# EAGLE board Encoder PCB - REV 17.2 (EAGLE 7.5.0)
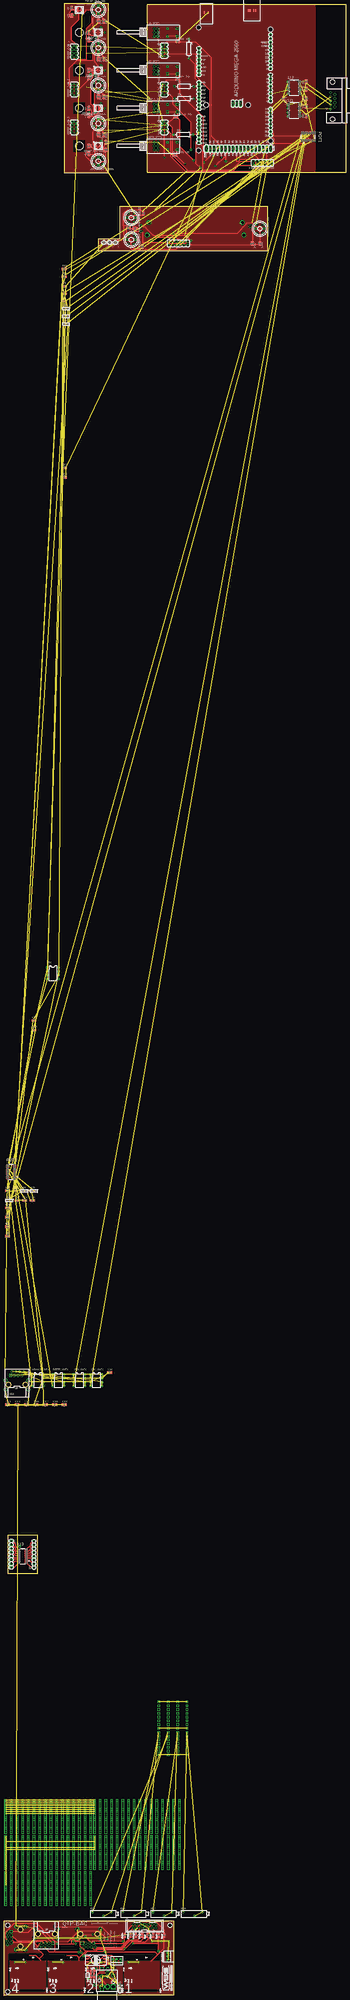
[diagram p11: board, top side]
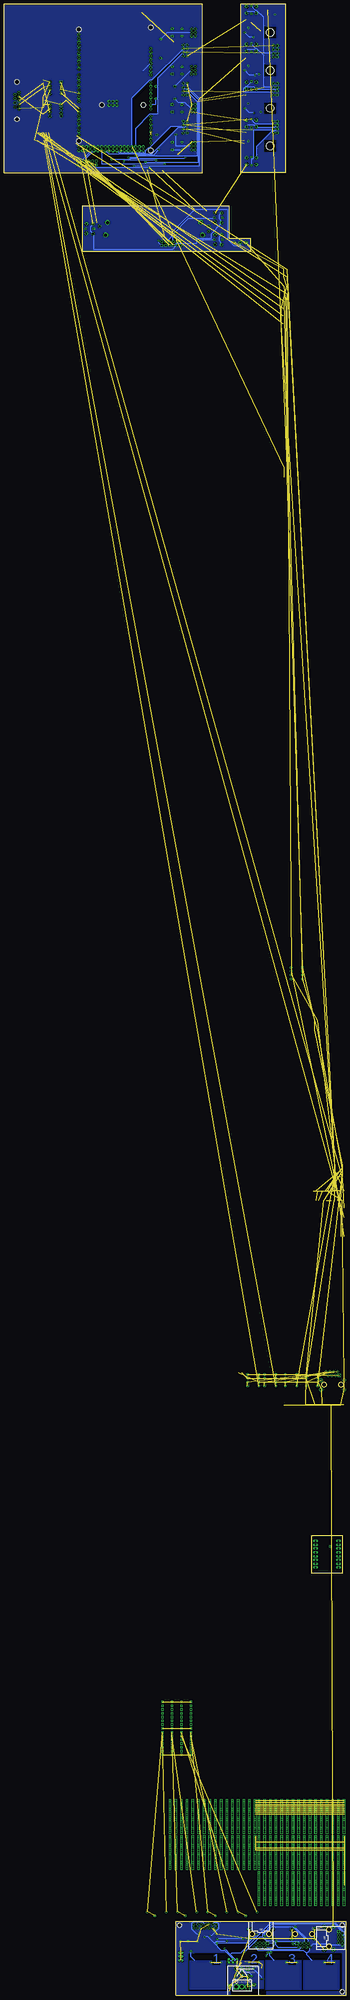
[diagram p12: board, bottom side, seen from below]

Size 229.87 x 1336.61 mm. Coordinates in mm from the lower left corner, seen from the top.
Outline: 0,0.32 0,49.85 114.3,49.85 114.3,0.32 0,0.32
Outline: 0,0.32 0,0
Outline: 40.64,1223.33 70.61,1223.33 70.61,1336.61 40.64,1336.61 40.64,1223.33
Outline: 63.88,1170.62 63.88,1179 78.11,1179 78.11,1200.59 177.17,1200.59 177.17,1170.62 63.88,1170.62
Outline: 96.52,1223.33 96.52,1336.36 229.87,1336.36 229.87,1223.33 96.52,1223.33
Outline: 2.54,283.53 22.84,283.53 22.84,308.93 2.54,308.93 2.54,283.53
Copper layers (1*16): Top 0.035mm / dielectric 1.5mm / Bottom 0.035mm
Design rules "LPKF Seneca Routing *": minimum track width 10mil, minimum drill 24mil, track to track 10mil, track to pad 10mil, pad to pad 10mil, via to via 10mil, smd to smd 8mil, copper to edge 10mil, drill to drill 10mil, minimum pad ring 14mil, minimum via ring 12mil, stop-mask expansion 4mil, vias tented up to drill 0mil, thermal gap 20mil
Net classes: 0 default: width 0.305 mm; 1 Pair 1: width 0.305 mm; 2 Pair 2: width 0.305 mm; 3 Pair 3: width 0.305 mm; 4 Pair 4: width 0.305 mm
Holes 5.08 mm at 50.8,1266.51 50.8,1241.11 50.8,1291.91 50.8,1317.31
Holes 2.8 mm at 111.76,47.31 2.54,47.31 2.54,2.86
tKeepout: area 47,1313.5 to 54.6,1321.1; area 1.8,35.1 to 3.8,36.1; 22 lines
bKeepout: area 1.5,35.1 to 3.6,36.4
tRestrict: area 47,1313.5 to 54.6,1321.1; area 47,1288.1 to 54.6,1295.7; area 47,1262.7 to 54.6,1270.3; area 47,1237.3 to 54.6,1244.9; area 1.5,34.9 to 3.8,36.4; 14 lines
bRestrict: area 47,1262.7 to 54.6,1270.3; area 47,1288.1 to 54.6,1295.7; area 47,1313.5 to 54.6,1321.1; area 47,1237.3 to 54.6,1244.9; area 1.5,34.9 to 3.8,36.4; 18 lines

## Footprints (pad centres in the part's own frame; a part is rotated, then mirrored left to right if it is on the bottom)
AMP_227161 = drill 0.9 pad 1.27: 1 0,-5.08; 2 -2.54,-5.08 | hole 2: -5.08,0; 5.08,0
C0805 = smd 1.3 x 1.5: 1 -0.95,0; 2 0.95,0
DIP8 = drill 0.8 square: P$1 -3.81,3.81 | drill 0.8: P$2 -3.81,1.27; P$3 -3.81,-1.27; P$4 -3.81,-3.81; P$5 3.81,3.81; P$6 3.81,1.27; P$7 3.81,-1.27; P$8 3.81,-3.81
WBS_10-081 = drill 1: P$1 0,2.5; P$2 0,0; P$3 0,-2.5; P$4 -2.5,2.5; P$5 -2.5,0; P$6 -2.5,-2.5 | drill 0.8 square: P$7 -9,2.5; P$8 -9,-2.5; P$9 -15.5,2.5; P$10 -15.5,-2.5
CON-PHOENIX_MC1.5/3-G-3.81 = drill 2.2 square: + 3.81,0 | drill 2.2: - 0,0; S -3.81,0
SWITCH-PODBUTTON = drill 0.8 pad 1.5: LEDA 0,2.7; LEDB 0,-2.7 | drill 1.2 pad 2: SW1A -3.25,2.25; SW1B -3.25,-2.25; SW2A 3.25,2.25; SW2B 3.25,-2.25
MA06-2 = drill 1.016 octagon: 1 -6.35,-1.27; 2 -6.35,1.27; 3 -3.81,-1.27; 4 -3.81,1.27; 5 -1.27,-1.27; 6 -1.27,1.27; 7 1.27,-1.27; 8 1.27,1.27; 9 3.81,-1.27; 10 3.81,1.27; 11 6.35,-1.27; 12 6.35,1.27
BOURNS-PTA6043_SLIDEPOT = drill 2 octagon: MOUNT1 -4.191,26.492; MOUNT2 4.166,25.349; MOUNT3 4.191,-37.389; MOUNT4 -4.191,-38.532 | drill 1.2: P$1 1.74,-42.724; P$3 -1.74,30.682 | drill 1.2 square: P$2 1.74,30.682
MA04-2 = drill 1.016 octagon: 1 -3.81,-1.27; 2 -3.81,1.27; 3 -1.27,-1.27; 4 -1.27,1.27; 5 1.27,-1.27; 6 1.27,1.27; 7 3.81,-1.27; 8 3.81,1.27
WS2812 = smd 2 x 1.1: DI 2,0; DO 2,-1.7; LEDVDD -2,0; NC -2,1.7; VDD 2,1.7; VSS -2,-1.7
LSP10 = drill 1.016 pad 2.159 octagon: MP 0,0
SJ = smd 1.168 x 1.6: 1 -0.762,0; 2 0.762,0
22-23-2031 = drill 1 long: 1 -2.54,0; 2 0,0; 3 2.54,0
1X08 = drill 1.016 long: 1 -8.89,0; 2 -6.35,0; 3 -3.81,0; 4 -1.27,0; 5 1.27,0; 6 3.81,0; 7 6.35,0; 8 8.89,0
PLACEHOLDER = drill 0.8 square: P$1 -12.7,8.89; P$2 -12.7,7.62; P$3 -12.7,6.35; P$4 -12.7,5.08; P$5 -12.7,3.81; P$6 -12.7,2.54; P$7 -12.7,1.27; P$8 -12.7,0; P$9 -12.7,-1.27; P$10 -12.7,-2.54; P$11 -12.7,-3.81; P$12 -12.7,-5.08; P$13 -12.7,-6.35; P$14 -12.7,-7.62; P$15 -12.7,-8.89; P$16 -12.7,-10.16; P$17 -12.7,-11.43; P$18 -12.7,-12.7; P$19 -8.89,8.89; P$20 -8.89,7.62; P$21 -8.89,6.35; P$22 -8.89,5.08; P$23 -8.89,3.81; P$24 -8.89,2.54; P$25 -8.89,1.27; P$26 -8.89,0; P$27 -8.89,-1.27; P$28 -8.89,-2.54; P$29 -8.89,-3.81; P$30 -8.89,-5.08; P$31 -8.89,-6.35; P$32 -8.89,-7.62; P$33 -8.89,-8.89; P$34 -8.89,-10.16; P$35 -8.89,-11.43; P$36 -8.89,-12.7; P$37 -5.08,8.89; P$38 -5.08,7.62; P$39 -5.08,6.35; P$40 -5.08,5.08; P$41 -5.08,3.81; P$42 -5.08,2.54; P$43 -5.08,1.27; P$44 -5.08,0; P$45 -5.08,-1.27; P$46 -5.08,-2.54; P$47 -5.08,-3.81; P$48 -5.08,-5.08; P$49 -5.08,-6.35; P$50 -5.08,-7.62; P$51 -5.08,-8.89; P$52 -5.08,-10.16; P$53 -5.08,-11.43; P$54 -5.08,-12.7; P$55 -1.27,8.89; P$56 -1.27,7.62; P$57 -1.27,6.35; P$58 -1.27,5.08; P$59 -1.27,3.81; P$60 -1.27,2.54; P$61 -1.27,1.27; P$62 -1.27,0; P$63 -1.27,-1.27; P$64 -1.27,-2.54; P$65 -1.27,-3.81; P$66 -1.27,-5.08; P$67 -1.27,-6.35; P$68 -1.27,-7.62; P$69 -1.27,-8.89; P$70 -1.27,-10.16; P$71 -1.27,-11.43; P$72 -1.27,-12.7; P$73 2.54,8.89; P$74 2.54,7.62; P$75 2.54,6.35; P$76 2.54,5.08; P$77 2.54,3.81; P$78 2.54,2.54; P$79 2.54,1.27; P$80 2.54,0; P$81 2.54,-1.27; P$82 2.54,-2.54; P$83 2.54,-3.81; P$84 2.54,-5.08; P$85 2.54,-6.35; P$86 2.54,-7.62; P$87 2.54,-8.89; P$88 2.54,-10.16; P$89 2.54,-11.43; P$90 2.54,-12.7; P$91 6.35,8.89; P$92 6.35,7.62; P$93 6.35,6.35; P$94 6.35,5.08; P$95 6.35,3.81; P$96 6.35,2.54; P$97 6.35,1.27; P$98 6.35,0; P$99 6.35,-1.27; P$100 6.35,-2.54; P$101 6.35,-3.81; P$102 6.35,-5.08; P$103 6.35,-6.35; P$104 6.35,-7.62; P$105 6.35,-8.89; P$106 6.35,-10.16; P$107 6.35,-11.43; P$108 6.35,-12.7; P$109 10.16,8.89; P$110 10.16,7.62; P$111 10.16,6.35; P$112 10.16,5.08; P$113 10.16,3.81; P$114 10.16,2.54; P$115 10.16,1.27; P$116 10.16,0; P$117 10.16,-1.27; P$118 10.16,-2.54; P$119 10.16,-3.81; P$120 10.16,-5.08; P$121 10.16,-6.35; P$122 10.16,-7.62; P$123 10.16,-8.89; P$124 10.16,-10.16; P$125 10.16,-11.43; P$126 10.16,-12.7; P$127 13.97,8.89; P$128 13.97,7.62; P$129 13.97,6.35; P$130 13.97,5.08; P$131 13.97,3.81; P$132 13.97,2.54; P$133 13.97,1.27; P$134 13.97,0; P$135 13.97,-1.27; P$136 13.97,-2.54; P$137 13.97,-3.81; P$138 13.97,-5.08; P$139 13.97,-6.35; P$140 13.97,-7.62; P$141 13.97,-8.89; P$142 13.97,-10.16; P$143 13.97,-11.43; P$144 13.97,-12.7; P$145 17.78,8.89; P$146 17.78,7.62; P$147 17.78,6.35; P$148 17.78,5.08; P$149 17.78,3.81; P$150 17.78,2.54; P$151 17.78,1.27; P$152 17.78,0; P$153 17.78,-1.27; P$154 17.78,-2.54; P$155 17.78,-3.81; P$156 17.78,-5.08; P$157 17.78,-6.35; P$158 17.78,-7.62; P$159 17.78,-8.89; P$160 17.78,-10.16; P$161 17.78,-11.43; P$162 17.78,-12.7; P$163 21.59,8.89; P$164 21.59,7.62; P$165 21.59,6.35; P$166 21.59,5.08; P$167 21.59,3.81; P$168 21.59,2.54; P$169 21.59,1.27; P$170 21.59,0; P$171 21.59,-1.27; P$172 21.59,-2.54; P$173 21.59,-3.81; P$174 21.59,-5.08; P$175 21.59,-6.35; P$176 21.59,-7.62; P$177 21.59,-8.89; P$178 21.59,-10.16; P$179 21.59,-11.43; P$180 21.59,-12.7; P$181 25.4,8.89; P$182 25.4,7.62; P$183 25.4,6.35; P$184 25.4,5.08; P$185 25.4,3.81; P$186 25.4,2.54; P$187 25.4,1.27; P$188 25.4,0; P$189 25.4,-1.27; P$190 25.4,-2.54; P$191 25.4,-3.81; P$192 25.4,-5.08; P$193 25.4,-6.35; P$194 25.4,-7.62; P$195 25.4,-8.89; P$196 25.4,-10.16; P$197 25.4,-11.43; P$198 25.4,-12.7; P$199 29.21,8.89; P$200 29.21,7.62; P$201 29.21,6.35; P$202 29.21,5.08; P$203 29.21,3.81; P$204 29.21,2.54; P$205 29.21,1.27; P$206 29.21,0; P$207 29.21,-1.27; P$208 29.21,-2.54; P$209 29.21,-3.81; P$210 29.21,-5.08; P$211 29.21,-6.35; P$212 29.21,-7.62; P$213 29.21,-8.89; P$214 29.21,-10.16; P$215 29.21,-11.43; P$216 29.21,-12.7; P$217 33.02,8.89; P$218 33.02,7.62; P$219 33.02,6.35; P$220 33.02,5.08; P$221 33.02,3.81; P$222 33.02,2.54; P$223 33.02,1.27; P$224 33.02,0; P$225 33.02,-1.27; P$226 33.02,-2.54; P$227 33.02,-3.81; P$228 33.02,-5.08; P$229 33.02,-6.35; P$230 33.02,-7.62; P$231 33.02,-8.89; P$232 33.02,-10.16; P$233 33.02,-11.43; P$234 33.02,-12.7; P$235 36.83,8.89; P$236 36.83,7.62; P$237 36.83,6.35; P$238 36.83,5.08; P$239 36.83,3.81; P$240 36.83,2.54; P$241 36.83,1.27; P$242 36.83,0; P$243 36.83,-1.27; P$244 36.83,-2.54; P$245 36.83,-3.81; P$246 36.83,-5.08; P$247 36.83,-6.35; P$248 36.83,-7.62; P$249 36.83,-8.89; P$250 36.83,-10.16; P$251 36.83,-11.43; P$252 36.83,-12.7; P$253 40.64,8.89; P$254 40.64,7.62; P$255 40.64,6.35; P$256 40.64,5.08; P$257 40.64,3.81; P$258 40.64,2.54; P$259 40.64,1.27; P$260 40.64,0; P$261 40.64,-1.27; P$262 40.64,-2.54; P$263 40.64,-3.81; P$264 40.64,-5.08; P$265 40.64,-6.35; P$266 40.64,-7.62; P$267 40.64,-8.89; P$268 40.64,-10.16; P$269 40.64,-11.43; P$270 40.64,-12.7; P$271 44.45,8.89; P$272 44.45,7.62; P$273 44.45,6.35; P$274 44.45,5.08; P$275 44.45,3.81; P$276 44.45,2.54; P$277 44.45,1.27; P$278 44.45,0; P$279 44.45,-1.27; P$280 44.45,-2.54; P$281 44.45,-3.81; P$282 44.45,-5.08; P$283 44.45,-6.35; P$284 44.45,-7.62; P$285 44.45,-8.89; P$286 44.45,-10.16; P$287 44.45,-11.43; P$288 44.45,-12.7
M0805 = smd 1.3 x 1.6: 1 -0.95,0; 2 0.95,0
MCS10B = drill 1.016 pad 2.159 octagon: MP 0,0
ARDUINO_MEGA2560 = drill 1.016 pad 1.88: 0 63.5,50.8; 1 60.96,50.8; 2 58.42,50.8; 3 55.88,50.8; 3.3V 35.56,2.54; 4 53.34,50.8; 5 50.8,50.8; 5V 38.1,2.54; 5V. 93.98,50.8; 5V.. 96.52,50.8; 6 48.26,50.8; 7 45.72,50.8; 8 41.656,50.8; 9 39.116,50.8; 10 36.576,50.8; 11 34.036,50.8; 12 31.496,50.8; 13 28.956,50.8; 14 68.58,50.8; 15 71.12,50.8; 16 73.66,50.8; 17 76.2,50.8; 18 78.74,50.8; 19 81.28,50.8; 20 83.82,50.8; 21 86.36,50.8; A0 50.8,2.54; A1 53.34,2.54; A2 55.88,2.54; A3 58.42,2.54; A4 60.96,2.54; A5 63.5,2.54; A6 66.04,2.54; A7 68.58,2.54; A8 73.66,2.54; A9 76.2,2.54; A10 78.74,2.54; A11 81.28,2.54; A12 83.82,2.54; A13 86.36,2.54; A14 88.9,2.54; A15 91.44,2.54; AREF 23.876,50.8; GND 26.416,50.8; GND. 43.18,2.54; GND.. 40.64,2.54; GND... 93.98,7.62; GND.... 96.52,7.62; I/OREF 30.48,2.54; N/C 27.94,2.54; RESET 33.02,2.54; SCL1 18.796,50.8; SDA1 21.336,50.8; VIN 45.72,2.54 | drill 1.016 pad 1.88 octagon: 22 93.98,48.26; 23 96.52,48.26; 24 93.98,45.72; 25 96.52,45.72; 26 93.98,43.18; 27 96.52,43.18; 28 93.98,40.64; 29 96.52,40.64; 30 93.98,38.1; 31 96.52,38.1; 32 93.98,35.56; 33 96.52,35.56; 34 93.98,33.02; 35 96.52,33.02; 36 93.98,30.48; 37 96.52,30.48; 38 93.98,27.94; 39 96.52,27.94; 40 93.98,25.4; 41 96.52,25.4; 42 93.98,22.86; 43 96.52,22.86; 44 93.98,20.32; 45 96.52,20.32; 46 93.98,17.78; 47 96.52,17.78; 48 93.98,15.24; 49 96.52,15.24; 50 93.98,12.7; 51 96.52,12.7; 52 93.98,10.16; 53 96.52,10.16; +5V_ 66.04,30.48; GND__ 66.04,25.4; MISO 63.5,30.48; MOSI 66.04,27.94; RESET. 63.5,25.4; SCK 63.5,27.94 | smd 1.016 x 0.508: <PWR>+V 3.81,8.89; <PWR>-V 3.81,6.35; <USB>+V 2.54,40.64; <USB>D+ 2.54,39.37; <USB>D- 2.54,36.83; <USB>GND 2.54,35.56 | hole 3.2: 15.24,50.8; 13.97,2.54; 66.04,35.56; 66.04,7.62; 90.17,50.8; 96.52,2.54
SOIC127P600X175-16N = smd 1.981 x 0.533: 1 -2.464,4.445; 2 -2.464,3.175; 3 -2.464,1.905; 4 -2.464,0.635; 5 -2.464,-0.635; 6 -2.464,-1.905; 7 -2.464,-3.175; 8 -2.464,-4.445; 9 2.464,-4.445; 10 2.464,-3.175; 11 2.464,-1.905; 12 2.464,-0.635; 13 2.464,0.635; 14 2.464,1.905; 15 2.464,3.175; 16 2.464,4.445
ASSMAN-RJ45 = drill 1.1: P1+ -3.162,17.196; P2+ -0.622,17.196; P2- 0.648,14.656; P3+ 1.918,17.196; P3- -1.892,14.656; P4+ 4.458,17.196; P4- 3.188,14.656 | drill 1.1 square: P1- -4.432,14.656 | drill 1.5: P$9 -7.744,5.131; P$10 7.767,5.131; P$11 -7.744,11.349; P$12 7.767,11.349 | hole 3.2: -5.702,8.306; 5.728,8.306 | hole 3.175: -5.702,8.306
0309/12 = drill 0.813 octagon: 1 -6.35,0; 2 6.35,0
RTRIM43P = drill 0.9: 1 -7.62,1.27; 2 0,-1.27; 3 5.08,1.27
R0805W = smd 1.5 x 1: 1 -1.052,0; 2 1.052,0
SJ_2 = smd 1.168 x 1.6: 1 -1.524,0; 2 0,0; 3 1.524,0
M450A_AMPLIFIER = drill 0.8 square: P$1 -3.81,10.16; P$2 -3.81,7.62; P$3 -3.81,5.08; P$4 -3.81,2.54; P$5 -3.81,0; P$6 -3.81,-2.54; P$7 -3.81,-5.08; P$8 -3.81,-7.62; P$9 -3.81,-10.16; P$10 -3.81,-12.7; P$11 -3.81,-15.24; P$12 -3.81,-17.78; P$13 -3.81,-20.32; P$14 -3.81,-22.86; P$15 -3.81,-25.4
SCHOTT_61454 = smd 0.965 x 1.778: P1 -3.01,-5.779; P2 -1.003,-5.779; P3 1.003,-5.779; P4 3.01,-5.779; P5 3.01,5.779; P6 1.003,5.779; P7 -1.003,5.779; P8 -3.01,5.779
DIP254P762X508-8 = drill 1.118 square: 1 -7.62,7.62 | drill 1.118: 2 -7.62,5.08; 3 -7.62,2.54; 4 -7.62,0; 5 0,0; 6 0,2.54; 7 0,5.08; 8 0,7.62
VU_METER = drill 0.8 square: P$1 -5.08,0; P$2 5.08,0
H3M09RA = drill 1.092: 1 -5.537,1.422; 2 -2.769,1.422; 3 0,1.422; 4 2.769,1.422; 5 5.537,1.422; 6 -4.153,-1.422; 7 -1.384,-1.422; 8 1.384,-1.422; 9 4.153,-1.422 | hole 3.048: -12.497,0; 12.497,0
PAK100/2500-14 = drill 1 pad 1.422: 1 -7.62,-1.27; 2 -7.62,1.27; 3 -5.08,-1.27; 4 -5.08,1.27; 5 -2.54,-1.27; 6 -2.54,1.27; 7 0,-1.27; 8 0,1.27; 9 2.54,-1.27; 10 2.54,1.27; 11 5.08,-1.27; 12 5.08,1.27; 13 7.62,-1.27; 14 7.62,1.27
CON_NEUTRIK_A_BISEXUAL_H = drill 1.2 pad 2.184: CHASSIS -8.25,7; GROUND 0,12.7 | drill 1.6: F1 -3.81,12.7; F2 3.81,13.335; M1 3.81,17.78; SHARED3 0,17.462 | drill 1.6 pad 2.032 square: FAKEHOLE -3.81,3.81 | drill 1.6 square: M2 -3.81,17.78 | hole 1.2: 0,12.7 | hole 1.6: 3.81,8.89

## Placement (x,y rotation side)
APK1  Quad Summing  [WBS-FRAME_PCB]  1.27,199.71 0 top
APK3  VU METER PANEL  [WBS-FRAME_PCB]  1.27,1352.87 0 top  (outside the outline)
BNC2  1-227161-0  [AMP_227161]  69.34,10.22 180 top
C1  104  [C0805]  57.15,1312.23 270 top
C2  104  [C0805]  57.15,1286.83 270 top
C3  104  [C0805]  57.15,1261.43 90 top
C4  104  [C0805]  57.15,1236.03 90 top
C5  104  [C0805]  45.72,1328.74 90 top
C6  [C0805]  40.64,1147.13 0 top
C7  [C0805]  40.64,1142.05 0 top
C8  [C0805]  40.64,1136.97 0 top
C9  100n  [C0805]  20.32,654.37 0 top
C10  100n  [C0805]  20.32,648.02 0 top
C11  [C0805]  19.05,533.72 0 top
C12  [C0805]  8.89,533.72 0 top
C14  100n/50v  [C0805]  70.17,23.18 90 top
C21  [C0805]  13.97,533.72 0 top
C22  100n  [C0805]  71.12,418.15 0 top
C23  100n  [C0805]  2.54,396.56 0 top
C24  100n  [C0805]  8.89,396.56 0 top
C25  100n  [C0805]  15.24,396.56 0 top
C26  100n  [C0805]  21.59,396.56 0 top
C27  100n  [C0805]  27.94,396.56 0 top
C28  100n  [C0805]  34.29,396.56 0 top
C29  100n  [C0805]  40.64,396.56 0 top
EARTH_OUT1  OPAMP-THAT1646_LINE_DRIVER  [DIP8]  36.83,413.07 0 top
EARTH_POT1  WBS_10-081_DUALPOT+DUALSWITCH  [WBS_10-081]  101.09,1241.11 180 top
EURO-BLOCK_2  CON-PHOENIX_RIGHT_ANGLE_3.81  [CON-PHOENIX_MC1.5/3-G-3.81]  69.85,6.03 180 bottom
FADER_BUT_ON  SWITCH-POD-BUTTON_WITH_LED  [SWITCH-PODBUTTON]  172.08,1185.61 90 top
FADER_BUT_ONLY  SWITCH-POD-BUTTON_WITH_LED  [SWITCH-PODBUTTON]  85.72,1178.24 90 top
FADER_BUT_SEL  SWITCH-POD-BUTTON_WITH_LED  [SWITCH-PODBUTTON]  85.72,1192.97 90 top
FADER_CONNECTOR  [MA06-2]  173.99,1229.68 180 top
FADER_LIN_SLIDE  BOURNS-PTA6043_SLIDEPOT  [BOURNS-PTA6043_SLIDEPOT]  122.81,1185.61 90 top
FRONT_BUT_EARTH  SWITCH-POD-BUTTON_WITH_LED  [SWITCH-PODBUTTON]  63.5,1230.95 0 top
FRONT_BUT_GRASS  SWITCH-POD-BUTTON_WITH_LED  [SWITCH-PODBUTTON]  63.5,1256.35 180 top
FRONT_BUT_SEL  SWITCH-POD-BUTTON_WITH_LED  [SWITCH-PODBUTTON]  63.5,1332.55 180 top
FRONT_BUT_SKY  SWITCH-POD-BUTTON_WITH_LED  [SWITCH-PODBUTTON]  63.5,1281.75 180 top
FRONT_BUT_SUN  SWITCH-POD-BUTTON_WITH_LED  [SWITCH-PODBUTTON]  63.5,1307.15 180 top
FRONT_CON_1  [MA04-2]  47.35,1304.61 90 top
FRONT_CON_2  [MA04-2]  47.35,1279.21 90 top
FRONT_CON_3  [MA04-2]  47.35,1253.81 90 top
FRONT_EARTH  WS2812  [WS2812]  63.5,1241.11 180 top
FRONT_GRASS  WS2812  [WS2812]  63.5,1266.51 180 top
FRONT_SKY  WS2812  [WS2812]  63.5,1291.91 180 top
FRONT_SUN  WS2812  [WS2812]  63.5,1317.31 180 top
FRONT_SUN1  WS2812  [WS2812]  50.8,1332.55 0 top
G2  LSP10  [LSP10]  78.11,6.67 0 top
GND-2  [SJ]  78.11,3.81 270 top
GRASS_OUT1  OPAMP-THAT1646_LINE_DRIVER  [DIP8]  22.86,413.07 0 top
GRASS_POT1  WBS_10-081_DUALPOT+DUALSWITCH  [WBS_10-081]  101.09,1266.51 180 top
GROUND_POST  22-23-2031  [22-23-2031]  110.81,26.35 270 top
JP1  [1X08]  5.08,296.23 270 top
JP2  [1X08]  20.32,296.23 90 top
LINE_IN  QTP-OUT  [PLACEHOLDER]  13.97,1476.06 0 top  (outside the outline)
LINK_1  0  [M0805]  187.96,1272.86 270 top
LSP1  MCS10B  [MCS10B]  67.31,1176.34 270 top
LSP2  MCS10B  [MCS10B]  71.12,1176.34 270 top
LSP3  MCS10B  [MCS10B]  74.93,1176.34 270 top
MAIN_TO_FRONT_CON_1  [MA04-2]  107.95,1305.24 90 top
MAIN_TO_FRONT_CON_2  [MA04-2]  107.95,1279.21 90 top
MAIN_TO_FRONT_CON_3  [MA04-2]  107.95,1253.81 90 top
NEOPIXEL1  QTP-IN  [PLACEHOLDER]  13.97,1407.48 0 top  (outside the outline)
OUT_A  QTP-IN  [PLACEHOLDER]  13.97,122.24 0 top
OUT_B  QTP-IN  [PLACEHOLDER]  73.66,122.24 0 top
PAN_CON_2  22-23-2031  [22-23-2031]  75.88,23.49 180 top
PCB1  ARDUINO_MEGA2560  [ARDUINO_MEGA2560]  128.52,1334.58 270 top
POT1  DS1808Z-050+  [SOIC127P600X175-16N]  204.47,1247.46 270 top
POT2  DS1808Z-050+  [SOIC127P600X175-16N]  5.08,552.77 0 top
QTP1  [ASSMAN-RJ45]  19.69,38.73 270 bottom
QTP2  [ASSMAN-RJ45]  57.15,49.85 180 bottom
QTP_CENTER  [ASSMAN-RJ45]  28.58,49.85 180 top
R1  150R  [M0805]  57.15,1317.31 90 top
R2  150R  [M0805]  57.15,1291.91 270 top
R3  150R  [M0805]  57.15,1266.51 90 top
R4  150R  [M0805]  57.15,1241.11 270 top
R5  150R  [M0805]  45.72,1333.82 90 top
R6  [0309/12]  124.46,1306.51 270 top
R7  [0309/12]  121.28,1281.11 0 top
R8  [0309/12]  121.28,1272.86 0 top
R9  10K  [M0805]  203.2,1284.29 90 top
R10  [0309/12]  120.65,1248.73 0 top
R11  10K  [M0805]  203.2,1261.43 90 top
R12  10K  [M0805]  203.2,1272.86 90 top
R13  10K  [M0805]  203.2,1267.78 90 top
R14  10K  [M0805]  203.2,1279.21 90 top
R15  4.7K  [M0805]  40.64,1158.56 0 top
R16  4.7K  [M0805]  40.64,1153.48 0 top
R17  4.7K  [M0805]  2.54,540.07 0 top
R18  4.7K  [M0805]  7.62,540.07 0 top
R19  10k  [M0805]  2.54,528.64 0 top
R20  10k  [M0805]  2.54,522.29 0 top
R21  10k  [M0805]  2.54,515.94 0 top
R22  10k  [M0805]  2.54,509.59 0 top
R23  330R  [M0805]  40.64,1025.21 0 top
R24  100k  [M0805]  40.64,1018.86 0 top
R25  [RTRIM43P]  67.31,54.93 0 top
R26  [RTRIM43P]  87.63,54.93 0 top
R27  [RTRIM43P]  107.95,54.93 0 top
R28  [RTRIM43P]  128.27,54.93 0 top
R201  0R  [R0805W]  60.64,13.65 90 top
R202  37R5  [R0805W]  58.42,13.65 90 top
R203  75R  [R0805W]  56.52,17.46 90 top
R204  37R5  [R0805W]  59.69,16.83 0 top
R_EARTH_SW  10K  [M0805]  114.94,1234.76 0 top
R_GRASS_SW  10K  [M0805]  115.57,1260.16 0 top
R_SKY_SW  10K  [M0805]  116.84,1285.56 0 top
R_SUN_SW  10K  [M0805]  116.84,1310.96 0 top
REARTH+  0R  [R0805W]  85.09,40.64 90 top
REARTH-  0R  [R0805W]  81.28,40.64 90 top
RGRASS+  0R  [R0805W]  92.71,40.64 90 top
RGRASS-  0R  [R0805W]  88.9,40.64 90 top
RS1  10K  [M0805]  63.5,1324.93 270 top
RS2  10K  [M0805]  67.31,1324.93 270 top
RS3  10K  [M0805]  63.5,1299.53 270 top
RS4  10K  [M0805]  67.31,1299.53 270 top
RS5  10K  [M0805]  63.5,1274.13 270 top
RS6  10K  [M0805]  67.31,1274.13 270 top
RS7  10K  [M0805]  63.5,1248.73 270 top
RS8  10K  [M0805]  67.31,1248.73 270 top
RS9  10K  [M0805]  68.58,1238.57 90 top
RS10  10K  [M0805]  68.58,1243.65 90 top
RS11  10K  [M0805]  83.69,1186.12 0 top
RS13  10K  [M0805]  93.09,1173.67 90 top
RS14  10K  [M0805]  93.6,1196.02 90 top
RS15  10K  [M0805]  88.27,1185.86 180 top
RS16  10K  [M0805]  172.08,1175.7 270 top
RS17  10K  [M0805]  167,1175.7 270 top
RSKY+  0R  [R0805W]  100.33,40.64 90 top
RSKY-  0R  [R0805W]  96.52,40.64 90 top
RSUN+  0R  [R0805W]  107.95,40.64 90 top
RSUN-  0R  [R0805W]  104.14,40.64 90 top
SJ1  [SJ_2]  41.91,1131.89 0 top
SJ2  [SJ_2]  41.91,1126.81 0 top
SJ3  [SJ_2]  41.91,1121.73 0 top
SJ4  [SJ_2]  13.97,540.07 0 top
SJ5  [SJ_2]  20.32,540.07 0 top
SJ6  [SJ_2]  3.81,533.72 0 top
SJ_2  [SJ]  56.52,13.65 90 top
SKY_OUT1  OPAMP-THAT1646_LINE_DRIVER  [DIP8]  62.23,413.07 0 top
SKY_POT1  WBS_10-081_DUALPOT+DUALSWITCH  [WBS_10-081]  101.09,1291.91 180 top
SUM_IN_1  QTP-OUT  [PLACEHOLDER]  13.97,98.11 0 top
SUM_IN_2  QTP-OUT  [PLACEHOLDER]  73.66,98.11 0 top
SUM_IN_3  QTP-OUT  [PLACEHOLDER]  13.97,73.98 0 top
SUMMING1  M450A_AMPLIFIER  [M450A_AMPLIFIER]  107.95,187.01 0 top
SUMMING2  M450A_AMPLIFIER  [M450A_AMPLIFIER]  114.3,187.01 0 top
SUMMING3  M450A_AMPLIFIER  [M450A_AMPLIFIER]  120.65,187.01 0 top
SUMMING4  M450A_AMPLIFIER  [M450A_AMPLIFIER]  127,187.01 0 top
SUN_OUT1  OPAMP-THAT1646_LINE_DRIVER  [DIP8]  50.8,413.07 0 top
SUN_POT1  WBS_10-081_DUALPOT+DUALSWITCH  [WBS_10-081]  101.09,1317.31 180 top
SV1  [MA06-2]  117.22,1175.7 0 top
T2  XFMR_SCHOTT_61454  [SCHOTT_61454]  61.91,23.81 270 top
U1  DS75176BN  [DIP254P762X508-8]  198.88,1261.17 0 top
U2  DS75176BN  [DIP254P762X508-8]  198.88,1276.41 0 top
U3  DS1808Z-050+  [SOIC127P600X175-16N]  12.7,294.96 0 top
U$1  OPAMP-THAT1246_LINE_RECEIVER  [DIP8]  33.02,686.12 0 top
U$3  [ASSMAN-RJ45]  8.89,401.64 0 top
U$5  [C1-4-150731-094535]  95.25,25.4 0 top
U$6  [C2-5-150731-094535]  69.85,25.4 0 top
U$7  VU_METER  [VU_METER]  69.85,1427.8 0 top  (outside the outline)
U$8  VU_METER  [VU_METER]  10.16,1451.93 0 top  (outside the outline)
U$9  VU_METER  [VU_METER]  29.21,1451.93 0 top  (outside the outline)
U$10  VU_METER  [VU_METER]  48.26,1451.93 0 top  (outside the outline)
U$11  [C3-6-150731-094535]  44.45,25.4 0 top
U$12  [C4-7-150731-094535]  19.05,25.4 0 top
U$13  [GND_1-8-150731-094535]  105.54,2.16 90 top
U$14  [GND_2-9-150731-094535]  80.14,2.16 90 top
U$15  [GND_3-10-150731-094535]  54.74,2.16 90 top
U$16  [GND_4-11-150731-094535]  29.34,2.16 90 top
U$17  [GROUND_P-12-150731-094535]  107,22.86 90 top
U$18  [R101-17-150731-094535]  86.36,8.89 90 top
U$19  [R102-18-150731-094535]  84.14,8.89 90 top
U$20  [R103-19-150731-094535]  80.96,16.51 90 top
U$21  [R104-20-150731-094535]  83.82,18.1 0 top
U$22  [R201-21-150731-094535]  60.96,8.89 90 top
U$23  [R202-22-150731-094535]  58.74,8.89 90 top
U$24  [R203-23-150731-094535]  55.56,16.51 90 top
U$25  [R204-24-150731-094535]  58.42,18.1 0 top
U$26  [R301-25-150731-094535]  35.56,8.89 90 top
U$27  [R302-26-150731-094535]  33.34,8.89 90 top
U$28  [R303-27-150731-094535]  30.16,16.51 90 top
U$29  [R304-28-150731-094535]  33.02,18.1 0 top
U$30  [R401-29-150731-094535]  10.16,8.89 90 top
U$31  [R402-30-150731-094535]  7.94,8.89 90 top
U$32  [R403-31-150731-094535]  4.76,16.51 90 top
U$33  [R404-32-150731-094535]  7.62,18.1 0 top
U$34  [REARTH_-33-150731-094535]  83.82,38.42 90 top
U$35  [REARTH_-34-150731-094535]  80.01,38.42 90 top
U$36  [RGRASS_-35-150731-094535]  91.44,38.42 90 top
U$37  [RGRASS_-36-150731-094535]  87.63,38.42 90 top
U$38  [RSKY_-37-150731-094535]  99.06,38.42 90 top
U$39  [RSKY_-38-150731-094535]  95.25,38.42 90 top
U$40  [RSUN_-39-150731-094535]  106.68,38.42 90 top
U$41  [RSUN_-40-150731-094535]  102.87,38.42 90 top
U$42  [SJ_1-41-150731-094535]  82.04,9.46 90 top
U$43  [SJ_2-42-150731-094536]  56.64,9.46 90 top
U$44  [SJ_3-43-150731-094536]  31.24,9.46 90 top
U$45  [SJ_4-44-150731-094536]  5.84,9.46 90 top
U$46  GND_PIN1_1  [T1-45-150731-094536]  88.9,23.81 0 top
U$47  GND_PIN1_2  [T2-46-150731-094536]  63.5,23.81 0 top
U$48  gnd  [T3-47-150731-094536]  38.1,23.81 0 top
U$49  gnd  [T4-48-150731-094536]  12.7,23.81 0 top
VU_METER_INPUT  QTP-OUT  [PLACEHOLDER]  13.97,1431.61 0 top  (outside the outline)
WBS1  MEGA interface  [WBS-FRAME_PCB]  39.37,974.41 0 top
WBS2  FRONT POT  [WBS-FRAME_PCB]  39.37,932.5 0 top
WBS3  Front Panel  [WBS-FRAME_PCB]  39.37,890.59 0 top
WBS4  Fader Panel  [WBS-FRAME_PCB]  39.37,848.68 0 top
WBS5  Serial Tranciever  [WBS-FRAME_PCB]  39.37,806.77 0 top
WBS6  Balanced Line RX - Digital Pot  [WBS-FRAME_PCB]  1.27,352.11 0 top
WBS7  Balanced Line Driver  [WBS-FRAME_PCB]  1.27,310.2 0 top
WBS8  DS1882 Adapter  [WBS-FRAME_PCB]  1.27,241.62 0 top
WBS9  QTP-BAC  [WBS-FRAME_PCB]  12.7,-70.17 0 top  (outside the outline)
X1  D-SUB9-H3M09RA  [H3M09RA]  220.98,1271.59 90 top
X2  2514-  [PAK100/2500-14]  94.62,46.67 0 top
XLR2  CON-XLR-NEUTRIK_A_BISEXUAL  [CON_NEUTRIK_A_BISEXUAL_H]  69.85,0.32 0 top

## Tracks (layer width: path | path; a pad name or v marks a point on that pad's centre or on a via)
0V  (3 unrouted)
+5V  (26 unrouted)
  Top 0.305: MAIN_TO_FRONT_CON_3.7 110.49,1256.35 | 110.49,1256.35 113.03,1253.81 113.03,1235.39 113.67,1234.76 R_EARTH_SW.1 114.3,1234.76 114.3,1234.12 123.19,1225.23 123.19,1224.6 154.31,1224.6 158.12,1228.41 FADER_CONNECTOR.12 | 110.49,1256.35 114.3,1260.16 R_GRASS_SW.1 | R_SKY_SW.1 109.22,1285.56 MAIN_TO_FRONT_CON_2.7 | R_SUN_SW.1 109.22,1310.96 MAIN_TO_FRONT_CON_1.7 | 93.34,1176.34 93.34,1183.32 92.71,1183.32 FADER_LIN_SLIDE.P$3 92.08,1183.96 88.27,1183.96 86.36,1185.86 | 93.34,1176.34 93.34,1175.07 RS13.2 | 86.36,1185.86 85.09,1185.86 RS11.2 84.45,1186.5 83.82,1186.5 83.82,1187.13 83.19,1187.77 80.65,1187.77 | 86.36,1185.86 RS15.2 | 80.65,1187.77 80.65,1196.02 83.19,1198.56 92.08,1198.56 93.34,1197.29 RS14.2 | LSP3.MP 76.2,1177.61 78.74,1177.61 80.65,1179.51 80.65,1187.77 | 167,1175.07 172.08,1175.07 RS16.2 | 167,1175.07 125.73,1175.07 123.83,1176.97 SV1.12 123.19,1176.97 121.92,1175.7 109.22,1175.7 108.58,1176.34 93.34,1176.34 | 167,1175.07 RS17.2
  Bottom 0.305: 136.53,1291.27 131.44,1296.35 PCB1.5V
  pour Top: 40.01,1336.99 73.66,1337.63 73.66,1222.06 38.73,1221.42
  pour Bottom: 104.14,1243.65 99.06,1243.65 99.06,1235.39 114.3,1235.39 114.3,1233.49 97.79,1233.49 97.79,1321.75 104.14,1321.75 104.14,1319.85 99.06,1319.85 99.06,1310.32 127,1310.32 127,1297.62 133.35,1297.62 133.35,1295.72 125.73,1295.72 125.73,1308.42 99.06,1308.42 99.06,1296.35 104.14,1296.35 104.14,1294.45 99.06,1294.45 99.06,1284.92 112.39,1284.92 112.39,1283.02 99.06,1283.02 99.06,1270.95 104.14,1270.95 104.14,1269.05 99.06,1269.05 99.06,1259.52 112.39,1259.52 112.39,1257.62 99.06,1257.62 99.06,1246.19 104.14,1246.19
  pour Bottom: 97.79,1335.09 230.5,1335.09 230.5,1332.55 99.69,1332.55 99.69,1321.75 97.79,1321.75
+12V  (13 unrouted)
+24V  (3 unrouted)
-12V  (13 unrouted)
-24V  (3 unrouted)
A0_FNT_POT_SUN
  Top 0.305: R6.2 128.91,1295.72 128.91,1286.19 130.81,1284.29 PCB1.A0
A1_FNT_POT_SKY
  Top 0.305: R7.2 130.81,1281.11 PCB1.A1
A6_FNT_POT_GRASS
  Bottom 0.305: R8.2 127.64,1269.05 130.81,1269.05 PCB1.A6
A12_FNT_POT_EARTH  (1 unrouted)
  Top 0.305: 130.81,1248.73 R10.2
A14_FDR_POT_POSITION  (via drill 0.61)  (1 unrouted)
  Top 0.305: v132.08,1226.5 128.91,1229.68 128.91,1243.65 130.81,1245.55 PCB1.A14
  Bottom 0.305: FADER_CONNECTOR.10 168.28,1226.5 v132.08,1226.5 | LSP2.MP 71.12,1173.8 74.93,1173.8 79.38,1178.24 79.38,1198.56 101.6,1198.56 116.84,1183.32 116.84,1180.78 120.65,1176.97 SV1.10
A15_FDR_POT_SLIDE  (via drill 0.61)  (1 unrouted)
  Top 0.305: FADER_CONNECTOR.11 159.38,1230.95 153.67,1225.23 133.35,1225.23 133.35,1241.11 131.44,1243.01 PCB1.A15 | v125.73,1177.61 121.92,1181.42 100.33,1181.42 94.62,1187.13 92.71,1187.13 FADER_LIN_SLIDE.P$2
  Bottom 0.305: v125.73,1177.61 125.73,1176.34 123.83,1174.43 SV1.11
CH1+1  (via drill 0.61)
  Top 0.305: 103.44,27.64 99.39,23.6 98.9,23.6 | 103.44,27.64 107.81,32.02 107.81,39.45 RSUN+.1 | 103.44,27.64 101.54,29.54 v68.02,29.54
  Bottom 0.305: 55.72,39.36 53,36.64 48.37,36.64 47.22,35.48 47.22,34.49 47.3,34.41 | 55.72,39.36 55.8,39.45 55.8,41.76 49.37,48.2 7.59,48.2 2.64,43.24 2.64,41.92 QTP1.P1+ | 47.3,34.41 49.03,32.68 53.99,32.68 QTP2.P1+ | 47.3,34.41 45.57,32.68 31.86,32.68 QTP_CENTER.P1+ | v68.02,29.54 58.28,39.28 55.8,39.28 55.72,39.36
CH1-1  (via drill 0.61)
  Top 0.305: v104.01,29.87 104.01,35.15 | 104.01,35.15 104.01,39.45 RSUN-.1 | QTP1.P1- 5.12,43.08 9.91,43.08 10.57,42.42 16.18,42.42 20.14,46.38 21.79,46.38 32.86,35.32 QTP_CENTER.P1- | v35.66,34.99 45.57,34.99 | 45.57,34.99 v48.37,34.99 | v86.68,35.15 104.01,35.15 | v59.77,41.1 54.15,41.1 51.18,38.13 51.18,37.96 50.02,36.8 48.21,36.8 47.22,37.8 46.23,37.8 45.57,37.13 45.57,34.99
  Bottom 0.305: v104.01,29.87 104.01,26.24 101.37,23.6 | v48.37,34.99 48.54,35.15 52.67,35.15 QTP2.P1- | v35.66,34.99 33.19,34.99 33.02,35.15 QTP_CENTER.P1- | v86.68,35.15 65.71,35.15 v59.77,41.1
CH2+1  (via drill 0.61)
  Top 0.305: EURO-BLOCK_2.+ 73.63,6.1 72.48,7.25 72.48,10.06 73.63,11.21 73.63,13.53 XLR2.F2 73.63,13.69 73.63,15.67 71.65,17.65 71.65,20.62 71.24,21.04 | XLR2.M2 66.04,18.15 67.69,19.8 T2.P5 67.69,20.95 71.16,20.95 71.24,21.04 | RSKY+.1 100.22,39.45 98.4,39.45 95.26,36.31 86.18,36.31 v81.39,31.52 80.57,30.7 67.53,30.7 66.37,29.54 55.97,29.54 53.66,27.23 v53.66,26.9 | 71.24,21.04 73.3,23.1 73.3,23.43 PAN_CON_2.1 | v51.51,31.52 51.51,29.71 v52.34,28.88
  Bottom 0.305: 51.51,31.19 55.14,31.19 56.46,32.51 QTP2.P2+ | 51.51,31.19 31.2,31.19 29.88,32.51 29.22,32.51 QTP_CENTER.P2+ | 77.51,27.64 73.47,23.6 PAN_CON_2.1 | 77.51,27.64 v81.39,31.52 | 77.51,27.64 76.44,28.71 70.5,28.71 50.36,48.86 7.26,48.86 0.99,42.58 0.99,41.43 2.48,39.94 2.48,39.45 QTP1.P2+ | v51.51,31.52 51.51,31.19 | v52.34,28.88 52.34,28.22 v53.66,26.9
CH2-1  (via drill 0.61)
  Top 0.305: QTP_CENTER.P2- 27.9,35.32 27.24,35.32 25.92,36.64 22.29,36.64 21.79,36.14 6.93,36.14 5.12,37.96 QTP1.P2- | v94.93,39.45 96.42,39.45 RSKY-.1 | 67.69,26.73 72.64,26.73 PAN_CON_2.2 | 58.86,35.73 59.77,36.64 v80.07,36.64 | 58.86,35.73 58.45,35.32 57.95,35.32 QTP2.P2- | 67.69,26.73 67.36,26.73 64.22,23.6 64.22,16.66 64.55,16.33 67.53,16.33 68.85,17.65 69.84,17.65 XLR2.SHARED3 | 67.69,26.73 T2.P8 | v63.56,13.03 69.84,6.76 69.84,6.1 EURO-BLOCK_2.- | 58.86,35.73 v54.65,39.94
  Bottom 0.305: v94.93,39.45 92.62,39.45 88.41,35.24 | 88.41,35.24 83.54,30.37 81.39,30.37 75.95,24.92 75.95,23.6 PAN_CON_2.2 | v80.07,36.64 87.01,36.64 88.41,35.24 | v63.56,13.03 63.4,13.2 63.4,14.19 64.72,15.51 65.05,15.51 65.22,15.67 67.03,15.67 68.35,16.99 68.68,16.99 69.34,17.65 69.84,17.65 XLR2.SHARED3 | v54.65,39.94 54.65,41.92 50.19,46.38 35.66,46.38 28.07,38.79 28.07,35.32 QTP_CENTER.P2-
CH3+1  (via drill 0.61)
  Top 0.305: 86.35,37.63 84.7,37.63 79.08,32.02 62.9,32.02 62.08,31.19 60.43,31.19 59.11,32.51 QTP2.P3+ | 86.35,37.63 90.31,37.63 92.13,39.45 92.62,39.45 RGRASS+.1 | v50.36,29.21 34.51,29.21 | 34.51,29.21 30.71,29.21 27.41,32.51 26.75,32.51 QTP_CENTER.P3+ | 34.42,36.23 34.51,36.14 34.51,29.21 | 34.42,36.23 22.45,48.2 6.77,48.2 0.99,42.42 0.99,38.79 2.48,37.3 2.48,36.97 QTP1.P3+ | v86.35,38.13 86.35,37.63 | v69.18,38.13 63.73,43.57 50.69,43.57 43.42,36.31 34.51,36.31 34.42,36.23
  Bottom 0.305: v50.36,29.21 51.18,28.38 51.18,26.73 48.04,23.6 | v69.18,38.13 v86.35,38.13
CH3-1  (via drill 0.61)
  Top 0.305: QTP_CENTER.P3- 30.38,35.32 29.88,35.32 27.9,37.3 21.96,37.3 21.46,36.8 8.91,36.8 5.12,40.6 QTP1.P3- | 50.6,25.5 50.52,25.41 50.52,23.6 | 50.6,25.5 54.9,29.79 | 54.9,29.79 55.31,30.2 62.08,30.2 63.23,31.36 79.41,31.36 85.03,36.97 92.13,36.97 93.78,38.62 93.78,42.75 93.45,43.08 92.13,43.08 91.63,42.58 91.63,42.25 88.99,39.61 RGRASS-.1 | 42.43,26.73 49.37,26.73 50.6,25.5 | 51.35,36.14 51.35,33.34 54.9,29.79 | 51.35,36.14 51.35,36.31 51.68,36.64 53.82,36.64 55.14,35.32 QTP2.P3- | v46.72,36.64 47.38,36.64 47.88,36.14 51.35,36.14
  Bottom 0.305: v46.72,36.64 31.86,36.64 30.54,35.32 QTP_CENTER.P3-
CH4+1
  Top 0.305: REARTH+.1 85.03,39.45 85.03,38.95 78.75,32.68 61.75,32.68 QTP2.P4+
  Bottom 0.305: 26.33,28.47 26.42,28.38 26.42,27.39 22.62,23.6 | 26.33,28.47 24.27,30.53 24.27,32.51 QTP_CENTER.P4+ 24.11,32.68 21.79,34.99 10.57,34.99 9.74,34.16 2.64,34.16 QTP1.P4+ | 26.33,28.47 28.23,30.37 58.78,30.37 60.92,32.51 61.58,32.51 QTP2.P4+
CH4-1  (via drill 0.61)
  Top 0.305: QTP2.P4- 60.43,35.32 80.4,35.32 81.23,36.14 81.23,39.45 REARTH-.1 81.23,39.61 72.48,39.61 65.71,46.38 v34.01,46.38 | 17,26.73 21.96,26.73 23.86,24.83 | 25.09,23.6 23.86,24.83 | 22.7,33.25 22.62,33.17 22.62,31.69 26.42,27.89 26.42,27.39 23.86,24.83 | 22.7,33.25 24.6,35.15 25.26,35.15 QTP_CENTER.P4- | 22.7,33.25 20.47,35.48 5.12,35.48 QTP1.P4-
  Bottom 0.305: v34.01,46.38 34.01,45.72 25.43,37.13 25.43,35.32 QTP_CENTER.P4-
D02_SCI_TX_3RC2  (2 unrouted)
D14_SCI_TX3  (1 unrouted)
D15_SCI_RX3  (3 unrouted)
  Top 0.305: 179.7,1263.97 PCB1.15
D20_SCI_I2C_SDA  (3 unrouted)
  Top 0.305: POT1.13 205.11,1246.19 203.2,1248.09 180.98,1248.09 180.98,1249.36 179.7,1250.63 PCB1.20
D21_SCI_I2C_SCL  (3 unrouted)
  Top 0.305: POT1.14 206.38,1244.28 205.11,1243.01 181.61,1243.01 181.61,1246.19 179.7,1248.09 PCB1.21
D22_FDR_LED_KEY_ONLY  (via drill 0.61)  (2 unrouted)
  Top 0.305: v99.06,1177.61 100.97,1179.51 116.2,1179.51 118.75,1176.97 SV1.8
  Bottom 0.305: FADER_BUT_ONLY.LEDB 99.06,1178.24 v99.06,1177.61
D23_FDR_LED_KEY_SEL  (1 unrouted)
  Top 0.305: FADER_CONNECTOR.6 176.53,1229.68 176.53,1237.93 PCB1.23
  Bottom 0.305: FADER_BUT_SEL.LEDB 88.9,1192.85 106.05,1192.85 106.05,1192.21 116.2,1182.05 116.2,1176.97 SV1.6
D25_FDR_LED_KEY_CHON  (via drill 0.61)  (1 unrouted)
  Top 0.305: FADER_CONNECTOR.4 176.53,1227.14 173.99,1227.14 173.99,1237.93 PCB1.25 | v113.67,1182.69 156.84,1182.69 163.83,1189.67 167,1189.67 170.18,1186.5 173.99,1186.5 174.62,1185.86 FADER_BUT_ON.LEDB
  Bottom 0.305: v113.67,1182.69 113.67,1176.97 SV1.4
D27_FDR_KEY_CHON  (1 unrouted)
  Top 0.305: RS17.1 167,1182.69 169.55,1182.69 FADER_BUT_ON.SW1A
  Bottom 0.305: FADER_CONNECTOR.3 172.08,1236.66 172.08,1237.93 PCB1.27 | SV1.3 113.67,1174.43 116.2,1171.89 169.55,1171.89 169.55,1182.05 FADER_BUT_ON.SW1A 170.18,1182.69 171.45,1183.96 171.45,1187.13 170.18,1188.4 FADER_BUT_ON.SW2A
D29_FDR_KEY_SEL  (1 unrouted)
  Top 0.305: RS15.1 88.9,1185.86 88.9,1187.13 87,1187.13 85.09,1189.04 83.82,1189.04 83.19,1189.67 FADER_BUT_SEL.SW1A
  Bottom 0.305: FADER_CONNECTOR.5 175.26,1232.22 169.55,1237.93 PCB1.29 | SV1.5 115.57,1174.43 114.3,1175.7 100.33,1175.7 100.33,1178.24 99.69,1178.88 90.81,1178.88 90.81,1182.05 83.82,1189.04 83.82,1189.67 FADER_BUT_SEL.SW1A 83.82,1190.31 83.82,1190.94 85.09,1192.21 85.09,1194.75 83.82,1196.02 FADER_BUT_SEL.SW2A
D31_FDR_KEY_ONLY  (1 unrouted)
  Top 0.305: FADER_CONNECTOR.7 167,1236.66 167,1237.93 PCB1.31 | RS11.1 82.55,1185.86 82.55,1181.42 83.19,1181.42 FADER_BUT_ONLY.SW2A | SV1.7 118.11,1174.43 115.57,1171.89 95.25,1171.89 94.62,1171.26 91.44,1171.26 90.81,1171.89 85.72,1171.89 83.19,1174.43 FADER_BUT_ONLY.SW1A
  Bottom 0.305: FADER_BUT_ONLY.SW2A 83.82,1181.42 85.09,1180.15 85.09,1177.61 83.82,1176.34 83.82,1175.07 FADER_BUT_ONLY.SW1A
D33_FNT_SW_POT_EARTH  (via drill 0.61)  (1 unrouted)
  Top 0.305: 116.2,1234.76 116.2,1238.57 EARTH_POT1.P$9 | 116.2,1234.76 v121.92,1229.04 | 116.2,1234.76 R_EARTH_SW.2
  Bottom 0.305: EARTH_POT1.P$7 110.49,1238.57 116.2,1238.57 EARTH_POT1.P$9 | 163.83,1237.93 163.83,1229.04 v121.92,1229.04
D35_FNT_KEY_GRASS  (2 unrouted)
  Top 0.305: RS8.1 67.31,1250 65.41,1251.9 65.41,1253.17 66.67,1254.44 FRONT_BUT_GRASS.SW1A
  Bottom 0.305: FRONT_CON_3.6 46.36,1255.08 47.62,1253.81 59.69,1253.81 FRONT_BUT_GRASS.SW2A 60.33,1254.44 60.96,1254.44 61.59,1255.08 66.04,1255.08 66.67,1254.44 FRONT_BUT_GRASS.SW1A | MAIN_TO_FRONT_CON_3.6 107.95,1253.81 112.39,1253.81 130.18,1236.03 159.38,1236.03 161.29,1237.93
D37_FNT_KEY_EARTH  (via drill 0.61)  (2 unrouted)
  Top 0.305: 67.31,1235.39 67.31,1233.49 FRONT_BUT_EARTH.SW2A | 67.31,1235.39 67.31,1241.11 68.58,1242.38 RS10.1 | 67.31,1235.39 61.59,1235.39 61.59,1234.12 60.33,1232.85 FRONT_BUT_EARTH.SW1A | MAIN_TO_FRONT_CON_3.4 107.95,1251.27 v107.95,1233.49 | v157.48,1232.22 158.75,1233.49 158.75,1237.93
  Bottom 0.305: FRONT_CON_3.4 46.36,1252.54 47.62,1251.27 49.53,1251.27 59.69,1241.11 59.69,1233.49 FRONT_BUT_EARTH.SW1A | v107.95,1233.49 108.58,1232.85 144.78,1232.85 145.42,1232.22 v157.48,1232.22
D39_FNT_LED_KEY_EARTH  (1 unrouted)
  Top 0.305: MAIN_TO_FRONT_CON_3.3 112.39,1249.36 112.39,1234.12 122.56,1223.96 168.91,1223.96 168.91,1231.58 168.28,1232.22 158.75,1232.22 158.75,1231.58 158.12,1230.95 156.21,1230.95 156.21,1237.93 PCB1.39
  Bottom 0.305: FRONT_BUT_EARTH.LEDB 63.5,1232.22 62.87,1232.22 62.23,1232.85 62.23,1251.9 48.9,1251.9 48.26,1252.54 FRONT_CON_3.3
D41_FNT_LED_KEY_GRASS  (1 unrouted)
  Bottom 0.305: FRONT_BUT_GRASS.LEDB 63.5,1258.89 60.33,1255.71 48.9,1255.71 48.26,1255.08 FRONT_CON_3.5 | MAIN_TO_FRONT_CON_3.5 109.86,1254.44 117.47,1254.44 132.08,1239.84 132.72,1239.84 134.62,1237.93 134.62,1236.66 152.4,1236.66 153.67,1237.93 PCB1.41
D43_FNT_SW_POT_GRASS  (via drill 0.61)  (1 unrouted)
  Top 0.305: 116.84,1260.16 116.84,1263.97 GRASS_POT1.P$9 116.2,1263.97 110.49,1263.97 GRASS_POT1.P$7 | 151.13,1237.93 149.22,1236.03 v149.22,1230.95 | v127.64,1231.58 118.11,1241.11 118.11,1258.89 116.84,1260.16 | 116.84,1260.16 R_GRASS_SW.2
  Bottom 0.305: v149.22,1230.95 148.59,1231.58 v127.64,1231.58
D45_FNT_KEY_SUN  (via drill 0.61)  (1 unrouted)
  Top 0.305: RS4.1 67.31,1300.8 65.41,1302.7 65.41,1303.97 66.67,1305.24 FRONT_BUT_SUN.SW1A | FRONT_CON_2.6 45.72,1280.48 43.81,1282.38 43.81,1293.18 48.9,1298.26 59.69,1298.26 59.69,1304.61 FRONT_BUT_SUN.SW2A | v142.24,1227.77 148.59,1234.12 148.59,1237.93 PCB1.45
  Bottom 0.305: FRONT_BUT_SUN.SW1A 66.67,1305.24 66.04,1305.88 61.59,1305.88 60.96,1305.24 60.33,1305.24 FRONT_BUT_SUN.SW2A | MAIN_TO_FRONT_CON_2.6 106.05,1279.84 105.41,1279.84 98.42,1272.86 98.42,1227.77 v142.24,1227.77
D46_FNT_SW_POT_SUN
  Top 0.305: SUN_POT1.P$7 110.49,1314.77 116.2,1314.77 SUN_POT1.P$9 116.84,1314.77 117.47,1314.13 117.47,1310.96 R_SUN_SW.2 128.91,1310.96 139.06,1300.8 139.06,1248.09 146.05,1241.11 PCB1.46
D47_FNT_KEY_SKY  (via drill 0.61)  (1 unrouted)
  Top 0.305: RS6.1 67.31,1275.4 65.41,1277.3 65.41,1278.57 66.67,1279.84 FRONT_BUT_SKY.SW1A | v146.05,1233.49 146.05,1237.93 PCB1.47
  Bottom 0.305: FRONT_CON_2.4 46.36,1277.94 47.62,1279.21 59.69,1279.21 FRONT_BUT_SKY.SW2A 60.33,1279.84 60.96,1279.84 61.59,1280.48 66.04,1280.48 66.67,1279.84 FRONT_BUT_SKY.SW1A | MAIN_TO_FRONT_CON_2.4 99.69,1270.95 99.69,1234.76 139.06,1234.76 140.33,1233.49 v146.05,1233.49
D48_FNT_NEO_PIXEL  (3 unrouted)
  Top 0.305: 51.44,1332.55 50.8,1331.91 50.8,1326.2 45.72,1321.12 45.72,1312.23 48.26,1309.69 48.26,1308.42 FRONT_CON_1.7
  Bottom 0.305: MAIN_TO_FRONT_CON_1.5 130.18,1285.56 131.44,1285.56 143.51,1273.49 143.51,1241.11 PCB1.48
D49_FNT_LED_KEY_SKY  (via drill 0.61)  (1 unrouted)
  Top 0.305: MAIN_TO_FRONT_CON_2.3 113.67,1273.49 113.67,1269.05 125.73,1256.98 v125.73,1238.57 | v140.97,1234.76 143.51,1237.3 143.51,1237.93 PCB1.49
  Bottom 0.305: FRONT_BUT_SKY.LEDB 63.5,1284.29 66.67,1281.11 67.31,1281.11 68.58,1279.84 68.58,1277.3 48.9,1277.3 48.26,1277.94 FRONT_CON_2.3 | v125.73,1238.57 128.91,1235.39 140.33,1235.39 v140.97,1234.76
D50_FNT_LED_KEY_SEL  (1 unrouted)
  Bottom 0.305: FRONT_CON_1.3 55.25,1303.34 55.25,1327.47 59.69,1331.91 60.33,1331.91 63.5,1335.09 FRONT_BUT_SEL.LEDB | MAIN_TO_FRONT_CON_1.3 126.36,1286.83 126.36,1262.7 131.44,1262.7 140.97,1253.17 140.97,1241.11 PCB1.50
D51_FNT_LED_KEY_SUN  (via drill 0.61)  (1 unrouted)
  Top 0.305: v134.62,1230.31 140.97,1236.66 140.97,1237.93 PCB1.51
  Bottom 0.305: FRONT_CON_2.5 55.25,1280.48 55.25,1302.07 59.69,1306.51 60.33,1306.51 63.5,1309.69 FRONT_BUT_SUN.LEDB | MAIN_TO_FRONT_CON_2.5 107.95,1279.21 106.05,1279.21 99.06,1272.22 99.06,1230.31 v134.62,1230.31
D52_FNT_KEY_SEL  (1 unrouted)
  Top 0.305: RS2.1 67.31,1326.2 65.41,1328.1 65.41,1329.37 66.67,1330.64 FRONT_BUT_SEL.SW1A | FRONT_CON_1.2 46.36,1300.8 48.26,1298.89 55.25,1298.89 55.25,1319.85 59.05,1323.66 59.05,1328.1 60.33,1329.37 60.33,1330.01 FRONT_BUT_SEL.SW2A | MAIN_TO_FRONT_CON_1.2 107.95,1302.7 129.54,1302.7 129.54,1287.46 138.43,1278.57 138.43,1241.11 PCB1.52
  Bottom 0.305: FRONT_BUT_SEL.SW1A 66.67,1330.64 66.04,1331.28 61.59,1331.28 60.96,1330.64 60.33,1330.64 FRONT_BUT_SEL.SW2A
D53_FNT_SW_POT_SKY
  Top 0.305: SKY_POT1.P$7 110.49,1289.37 116.2,1289.37 SKY_POT1.P$9 116.84,1289.37 117.47,1288.73 117.47,1285.56 R_SKY_SW.2 118.11,1285.56 118.11,1276.67 133.99,1260.79 133.99,1236.66 137.16,1236.66 138.43,1237.93 PCB1.53
DB9_RS-485-RX+  (2 unrouted)
DB9_RS-485-RX-  (2 unrouted)
DB9_RS-485-TX+  (2 unrouted)
DB9_RS-485-TX-  (2 unrouted)
DCP_EARTH  (1 unrouted)
DCP_GRASS  (1 unrouted)
DCP_SKY  (1 unrouted)
DCP_SUN  (1 unrouted)
GND  (via drill 0.6, 0.61)  (57 unrouted)
  Top 0.305: C5.2 45.72,1329.37 v47.62,1329.37 48.26,1329.37 48.26,1330.64 FRONT_SUN1.VSS | C4.2 57.15,1236.66 55.25,1236.66 55.25,1234.12 59.69,1229.68 59.69,1229.04 FRONT_BUT_EARTH.SW1B | v57.15,1263.97 C3.2 | C2.2 57.15,1285.56 50.8,1279.21 50.8,1277.3 48.9,1275.4 FRONT_CON_2.1 | C1.2 57.15,1310.96 59.69,1310.96 59.69,1309.69 FRONT_BUT_SUN.SW2B | v65.41,1244.28 65.41,1243.01 FRONT_EARTH.VSS | v65.41,1269.68 65.41,1268.41 FRONT_GRASS.VSS | v65.41,1295.08 65.41,1293.81 FRONT_SKY.VSS | v65.41,1320.48 65.41,1319.21 FRONT_SUN.VSS | X2.6 91.96,47.87 89.65,45.55 X2.3 | X2.12 99.56,47.87 97.24,45.55 X2.9
  other vias: 99.69,36.51 106.05,36.51 111.12,36.51 88.27,43.88 87,41.59
  pour Bottom (rank 6): 233.17,1205.55 96.01,1201.74 93.98,1351.6 236.22,1338.9
  pour Bottom: 192.91,1163.76 50.16,1162.75 50.67,1204.4 191.52,1203.52
  pour Top: 192.91,1166.3 51.94,1164.02 51.94,1207.2 189.74,1205.29
  pour Bottom: 40.64,1223.33 40.64,1351.6 71.12,1351.6 75.95,1222.82
  pour Top: 85.72,1340.8 208.92,1340.8 208.92,1213.8 85.72,1213.8
  pour Top: 0,49.85 114.3,49.85 114.3,0.32 77.47,0.32 77.47,2.54 106.05,2.54 106.05,28.89 3.17,28.89 3.17,2.54 53.34,2.54 53.34,0.32 0,0.32
  pour Bottom: 0,49.85 114.3,49.85 114.3,0.32 77.47,0.32 77.47,2.54 106.05,2.54 106.05,28.89 3.17,28.89 3.17,2.54 53.34,2.54 53.34,0.32 0,0.32
GND_PIN1_1  (via drill 0.6)  (1 unrouted)
  other vias: 90.81,22.54 83.82,22.54
  pour Bottom: 80.65,23.49 80.65,4.44 104.78,4.44 104.78,23.49
  pour Top: 80.65,23.49 104.78,23.49 104.78,4.44 80.65,4.44
GND_PIN1_2  (via drill 0.6)  (13 unrouted)
  Top 0.406: C14.1 67.69,22.23 T2.P6
  other vias: 65.41,22.54 58.42,22.54
  pour Bottom: 55.25,23.49 55.25,4.44 79.38,4.44 79.38,23.49
  pour Top: 55.25,23.49 79.38,23.49 79.38,4.44 55.25,4.44
GND_PIN1_3  (via drill 0.6)  (1 unrouted)
  other vias: 33.02,22.54 40.01,22.54
  pour Bottom: 29.84,23.49 53.98,23.49 53.98,4.44 29.84,4.44
  pour Top: 29.84,23.49 53.98,23.49 53.98,4.44 29.84,4.44
GND_PIN1_4  (via drill 0.6)  (1 unrouted)
  other vias: 7.62,22.54 14.61,22.54
  pour Bottom: 4.45,23.49 28.58,23.49 28.58,4.44 4.45,4.44
  pour Top: 4.45,23.49 28.58,23.49 28.58,4.44 4.45,4.44
N$1
  Top 0.305: RS16.1 172.08,1185.23 169.55,1185.23 FADER_BUT_ON.LEDA
N$2
  Top 0.305: FRONT_BUT_GRASS.LEDA RS7.1
N$3
  Top 0.305: RS14.1 93.34,1194.75 87.63,1194.75 86.36,1193.48 83.19,1193.48 FADER_BUT_SEL.LEDA
N$4
  Top 0.305: FADER_BUT_ONLY.LEDA 85.09,1178.24 85.09,1174.43 87,1172.53 92.71,1172.53 RS13.1
N$5
  Top 0.305: FRONT_BUT_SKY.LEDA RS5.1
N$6  (1 unrouted)
N$7  (via drill 0.61)
  Top 0.305: C1.1 R1.1 57.15,1316.67 58.42,1315.4 60.96,1315.4 FRONT_SUN.VDD 61.59,1315.4 61.59,1314.77 v62.23,1314.13 | v67.94,1317.31 FRONT_SUN.LEDVDD
  Bottom 0.305: v67.94,1317.31 64.77,1314.13 v62.23,1314.13
N$8
  Bottom 0.305: R10.1 114.3,1241.11 EARTH_POT1.P$5
N$9
  Bottom 0.305: R7.1 104.14,1291.91 SKY_POT1.P$5
N$10
  Top 0.305: FRONT_BUT_SUN.LEDA RS3.1
N$11
  Bottom 0.305: R6.1 120.02,1317.31 SUN_POT1.P$5
N$12
  Top 0.305: FRONT_BUT_SEL.LEDA RS1.1
N$13
  Bottom 0.305: R8.1 112.39,1270.32 107.95,1270.32 104.14,1266.51 GRASS_POT1.P$5
N$14
  Top 0.305: FRONT_GRASS.DI 60.96,1266.51 59.69,1267.78 59.69,1268.41 58.42,1269.68 58.42,1285.56 59.69,1286.83 59.69,1292.54 60.96,1293.81 FRONT_SKY.DO
N$15  (1 unrouted)
N$16  (via drill 0.61)
  Top 0.305: 59.05,1289.37 59.05,1292.54 58.42,1293.18 57.15,1293.18 R2.1 | 59.05,1289.37 59.05,1288.1 57.15,1288.1 C2.1 | v60.96,1288.73 60.96,1290 FRONT_SKY.VDD | 59.05,1289.37 v58.42,1289.37 | v67.94,1291.91 FRONT_SKY.LEDVDD
  Bottom 0.305: v58.42,1289.37 60.33,1289.37 v60.96,1288.73 64.77,1288.73 v67.94,1291.91
N$17
  Top 0.305: RS9.1 68.58,1232.22 67.31,1230.95 63.5,1230.95 FRONT_BUT_EARTH.LEDA
N$19  (1 unrouted)
N$20  (via drill 0.61)
  Top 0.305: 59.05,1260.79 60.96,1260.79 60.96,1263.33 | 59.05,1260.79 57.15,1260.79 C3.1 | 60.96,1263.33 60.96,1264.6 FRONT_GRASS.VDD | 59.05,1260.79 59.05,1265.24 57.15,1265.24 R3.1 | v67.94,1266.51 FRONT_GRASS.LEDVDD | 60.96,1263.33 v61.59,1263.33
  Bottom 0.305: v67.94,1266.51 64.77,1263.33 v61.59,1263.33
N$21  (1 unrouted)
N$22
  Top 0.305: FRONT_SUN.DI 60.96,1317.31 59.69,1318.58 59.69,1326.83 62.23,1329.37 62.23,1331.28 60.96,1332.55 55.25,1332.55 55.25,1331.91 53.98,1330.64 53.34,1330.64 FRONT_SUN1.DO
N$23
  Top 0.305: 60.96,1238.57 60.96,1239.2 FRONT_EARTH.VDD 61.59,1239.2 62.87,1239.2 63.5,1239.84 63.5,1241.11 FRONT_EARTH.LEDVDD | 60.96,1238.57 60.96,1235.39 57.15,1235.39 C4.1 | 60.96,1238.57 58.42,1241.11 58.42,1241.74 57.15,1241.74 R4.1
N$24  (1 unrouted)
N$25
  Top 0.305: 45.72,1332.55 43.81,1330.64 43.81,1328.1 45.72,1328.1 C5.1 | 45.72,1332.55 FRONT_SUN1.LEDVDD 50.16,1332.55 50.8,1333.18 50.8,1334.45 52.7,1334.45 FRONT_SUN1.VDD | 45.72,1332.55 R5.1
N$26
  Top 0.305: FRONT_EARTH.DI 60.96,1241.11 59.69,1242.38 59.69,1250.63 62.23,1253.17 62.23,1262.06 63.5,1263.33 63.5,1267.78 62.87,1268.41 61.59,1268.41 FRONT_GRASS.DO 60.96,1268.41 60.96,1277.3 62.23,1278.57 62.23,1285.56 63.5,1286.83 63.5,1291.91 | 63.5,1291.91 FRONT_SKY.DI | 63.5,1291.91 63.5,1295.08 60.96,1297.62 60.96,1302.7 62.23,1303.97 62.23,1310.96 63.5,1312.23 63.5,1319.21 61.59,1319.21 FRONT_SUN.DO
N$27  (1 unrouted)
N$28
  Top 0.356: JP1.1 5.72,305.12 7.62,303.21 7.62,301.94 10.16,299.4 U3.1
N$29
  Top 0.356: U3.2 8.89,298.13 7.62,299.4 7.62,300.67 5.72,302.58 JP1.2
N$31
  Top 0.356: U3.3 7.62,296.86 7.62,298.13 5.72,300.04 JP1.3
N$32
  Top 0.356: U3.4 7.62,295.59 5.72,297.5 JP1.4
N$33
  Top 0.356: U3.5 5.08,294.32 JP1.5
N$34  (2 unrouted)
N$35
  Top 0.356: U3.6 5.08,293.05 JP1.6
N$36
  Top 0.356: U3.7 7.62,291.78 5.72,289.88 JP1.7
N$37  (2 unrouted)
N$38  (1 unrouted)
N$39  (1 unrouted)
N$40  (1 unrouted)
N$41  (2 unrouted)
N$42  (1 unrouted)
N$43
  Top 0.356: JP1.8 6.98,287.34 10.16,290.51 U3.8
N$44  (2 unrouted)
N$45  (1 unrouted)
N$46  (2 unrouted)
N$47  (2 unrouted)
N$48  (2 unrouted)
N$49  (2 unrouted)
N$50
  Top 0.356: JP2.1 18.41,287.34 15.24,290.51 U3.9
N$51
  Top 0.356: U3.10 17.78,291.78 19.69,289.88 JP2.2
N$52
  Top 0.356: U3.11 20.32,293.05 JP2.3
N$53
  Top 0.356: U3.12 20.32,294.32 JP2.4
N$54
  Top 0.356: U3.13 17.78,295.59 19.69,297.5 JP2.5
N$55
  Top 0.356: U3.14 17.78,296.86 17.78,298.13 19.69,300.04 JP2.6
N$56
  Top 0.356: U3.15 16.51,298.13 17.78,299.4 17.78,300.67 19.69,302.58 JP2.7
N$57
  Top 0.356: JP2.8 19.69,305.12 17.78,303.21 17.78,301.94 15.24,299.4 U3.16
N$58  (via drill 0.6)
  other vias: 10.67,301.56
N$59  (10 unrouted)
N$65  (9 unrouted)
N$76  (1 unrouted)
N$77  (1 unrouted)
N$78  (1 unrouted)
N$79  (1 unrouted)
N$80  (1 unrouted)
N$81  (1 unrouted)
N$82  (1 unrouted)
N$83  (1 unrouted)
N$84  (1 unrouted)
N$85  (1 unrouted)
N$86  (2 unrouted)
N$87  (1 unrouted)
N$88  (2 unrouted)
N$89  (1 unrouted)
N$90  (2 unrouted)
N$91  (1 unrouted)
N$92  (2 unrouted)
N$103  (1 unrouted)
N$104  (1 unrouted)
N$105  (1 unrouted)
N$106  (1 unrouted)
N$107  (1 unrouted)
N$108  (1 unrouted)
N$109  (1 unrouted)
N$110  (1 unrouted)
N$112  (6 unrouted)
N$116
  Top 0.305: 60.76,16.83 60.76,14.85 R201.2 | 60.76,16.83 62.41,16.83 63.23,17.65 63.23,19.96 56.46,26.73 56.13,26.73 T2.P1 | 60.76,16.83 R204.2
N$117  (via drill 0.61)
  Top 0.305: 58.61,16.83 58.45,16.66 58.45,14.85 R202.2 | v56.63,11.21 56.63,12.87 SJ_2.1 | v62.08,18.15 59.93,18.15 58.61,16.83 | 58.61,16.83 R204.1
  Bottom 0.305: v56.63,11.21 56.63,12.7 v62.08,18.15
N$118
  Top 0.305: R202.1 58.45,12.7 60.59,12.7 R201.1 60.76,12.7 61.58,12.7 63.89,15.01 69.34,15.01 BNC2.1
N$119
  Top 0.305: C14.2 70.17,24.26 68.19,24.26 67.69,24.75 T2.P7
N$130
  Top 0.305: R203.1 56.63,16.33 56.63,14.52 SJ_2.2
N$133
  Top 0.305: X2.10 98.56,49.35 102.69,49.35 107.81,44.23 107.81,41.76 RSUN+.2
N$134
  Top 0.305: REARTH-.2 81.39,41.76 81.39,42.42 86.84,47.87 X2.2
N$135
  Top 0.305: REARTH+.2 85.19,41.76 85.19,43.74 86.84,45.39 X2.1
N$136
  Top 0.305: RGRASS-.2 88.99,41.76 88.99,42.42 91.96,45.39 X2.5
N$137  (via drill 0.61)
  Top 0.305: v91.13,40.11 92.62,41.59 RGRASS+.2
  Bottom 0.305: v91.13,40.11 90.31,40.11 85.52,44.89 85.52,48.36 86.51,49.35 88.16,49.35 89.48,48.03 X2.4
N$138  (via drill 0.61)
  Top 0.305: v98.73,41.76 96.58,41.76 RSKY-.2
  Bottom 0.305: v98.73,41.76 100.55,41.76 103.68,44.89 103.68,48.36 102.69,49.35 96.09,49.35 94.77,48.03 X2.8
N$139
  Top 0.305: RSKY+.2 100.22,41.76 99.88,42.09 99.88,42.25 98.07,44.07 96.09,44.07 94.77,45.39 X2.7
N$140
  Top 0.305: RSUN-.2 104.01,41.76 103.35,41.76 99.72,45.39 X2.11
NEO_0V  (1 unrouted)
NEO_5V  (1 unrouted)
POT_A1_IN  (2 unrouted)
POT_B1_IN  (1 unrouted)
POT_B1_IN1  (1 unrouted)
UNBALANCED_OUT  (5 unrouted)

## Text on the board
Bottom: 4 | 3 | 2 | 1
tPlace: QuadTwistedPair.com | QTP-BAC | ISS-2 | 1 + p2 * ORG - SUN / 1 - p1 / 2 + p4 * BLU - SKY / 2 - p5 / 3 + p6 * GRN - GRASS / 3 - p3 / 4 + p8 * BRN - EARTH / 4 - p7 | 4 | 3 | 2 | 1